# Altium project GPS_Tracker.PrjPcb (part 1 of 2)
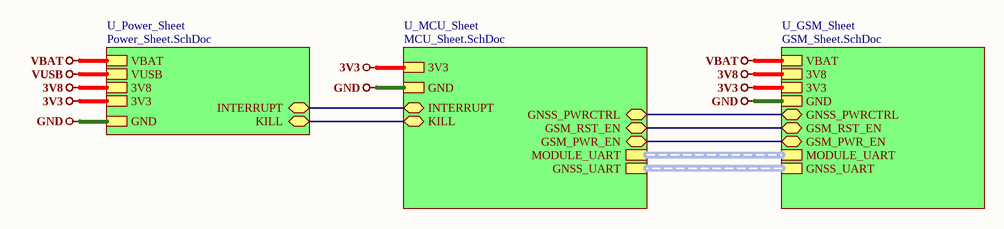
[diagram p0: Top_Sheet.SchDoc]
4 sheets, 134 parts. Net scope: hierarchical (ports join the sheet entries above them; power ports are global).
Sheets:
  Top_Sheet.SchDoc
    U_GSM_Sheet = GSM_Sheet.SchDoc
    U_Power_Sheet = Power_Sheet.SchDoc
    U_MCU_Sheet = MCU_Sheet.SchDoc

## Sheet Top_Sheet.SchDoc
size A4; SheetNumber: 1; SheetTotal: 4

### Sub-sheets
U_GSM_Sheet = GSM_Sheet.SchDoc: GSM_PWR_EN (bidir), GSM_RST_EN (bidir), MODULE_UART (harness MODULE_UART), GND, 3V8, VBAT, 3V3, GNSS_UART (harness GNSS_UART), GNSS_PWRCTRL (bidir)
U_MCU_Sheet = MCU_Sheet.SchDoc: MODULE_UART (harness MODULE_UART), GNSS_UART (harness GNSS_UART), GSM_PWR_EN (bidir), GSM_RST_EN (bidir), GNSS_PWRCTRL (bidir), GND, 3V3, INTERRUPT (bidir), KILL (bidir)
U_Power_Sheet = Power_Sheet.SchDoc: GND, 3V8, VUSB, VBAT, 3V3, INTERRUPT (bidir), KILL (bidir)

### Nets
3V3: sheet U_GSM_Sheet/3V3, sheet U_Power_Sheet/3V3, sheet U_MCU_Sheet/3V3
3V8: sheet U_GSM_Sheet/3V8, sheet U_Power_Sheet/3V8
GND: sheet U_GSM_Sheet/GND, sheet U_Power_Sheet/GND, sheet U_MCU_Sheet/GND
VBAT: sheet U_GSM_Sheet/VBAT, sheet U_Power_Sheet/VBAT
VUSB: sheet U_Power_Sheet/VUSB
GNSS_PWRCTRL: sheet U_GSM_Sheet/GNSS_PWRCTRL, sheet U_MCU_Sheet/GNSS_PWRCTRL
GSM_PWR_EN: sheet U_GSM_Sheet/GSM_PWR_EN, sheet U_MCU_Sheet/GSM_PWR_EN
GSM_RST_EN: sheet U_GSM_Sheet/GSM_RST_EN, sheet U_MCU_Sheet/GSM_RST_EN
INTERRUPT: sheet U_Power_Sheet/INTERRUPT, sheet U_MCU_Sheet/INTERRUPT
KILL: sheet U_Power_Sheet/KILL, sheet U_MCU_Sheet/KILL

### Buses and harness runs
harness sheet U_GSM_Sheet/GNSS_UART = sheet U_MCU_Sheet/GNSS_UART
harness sheet U_GSM_Sheet/MODULE_UART = sheet U_MCU_Sheet/MODULE_UART

### Notes on the sheet
- File:
- Title:
- Date:
- Page
- Num:
- Total:
- Drawn By: Huzaifa Ali

## Sheet GSM_Sheet.SchDoc
size 420 x 297 mm; SheetNumber: 4; SheetTotal: 4
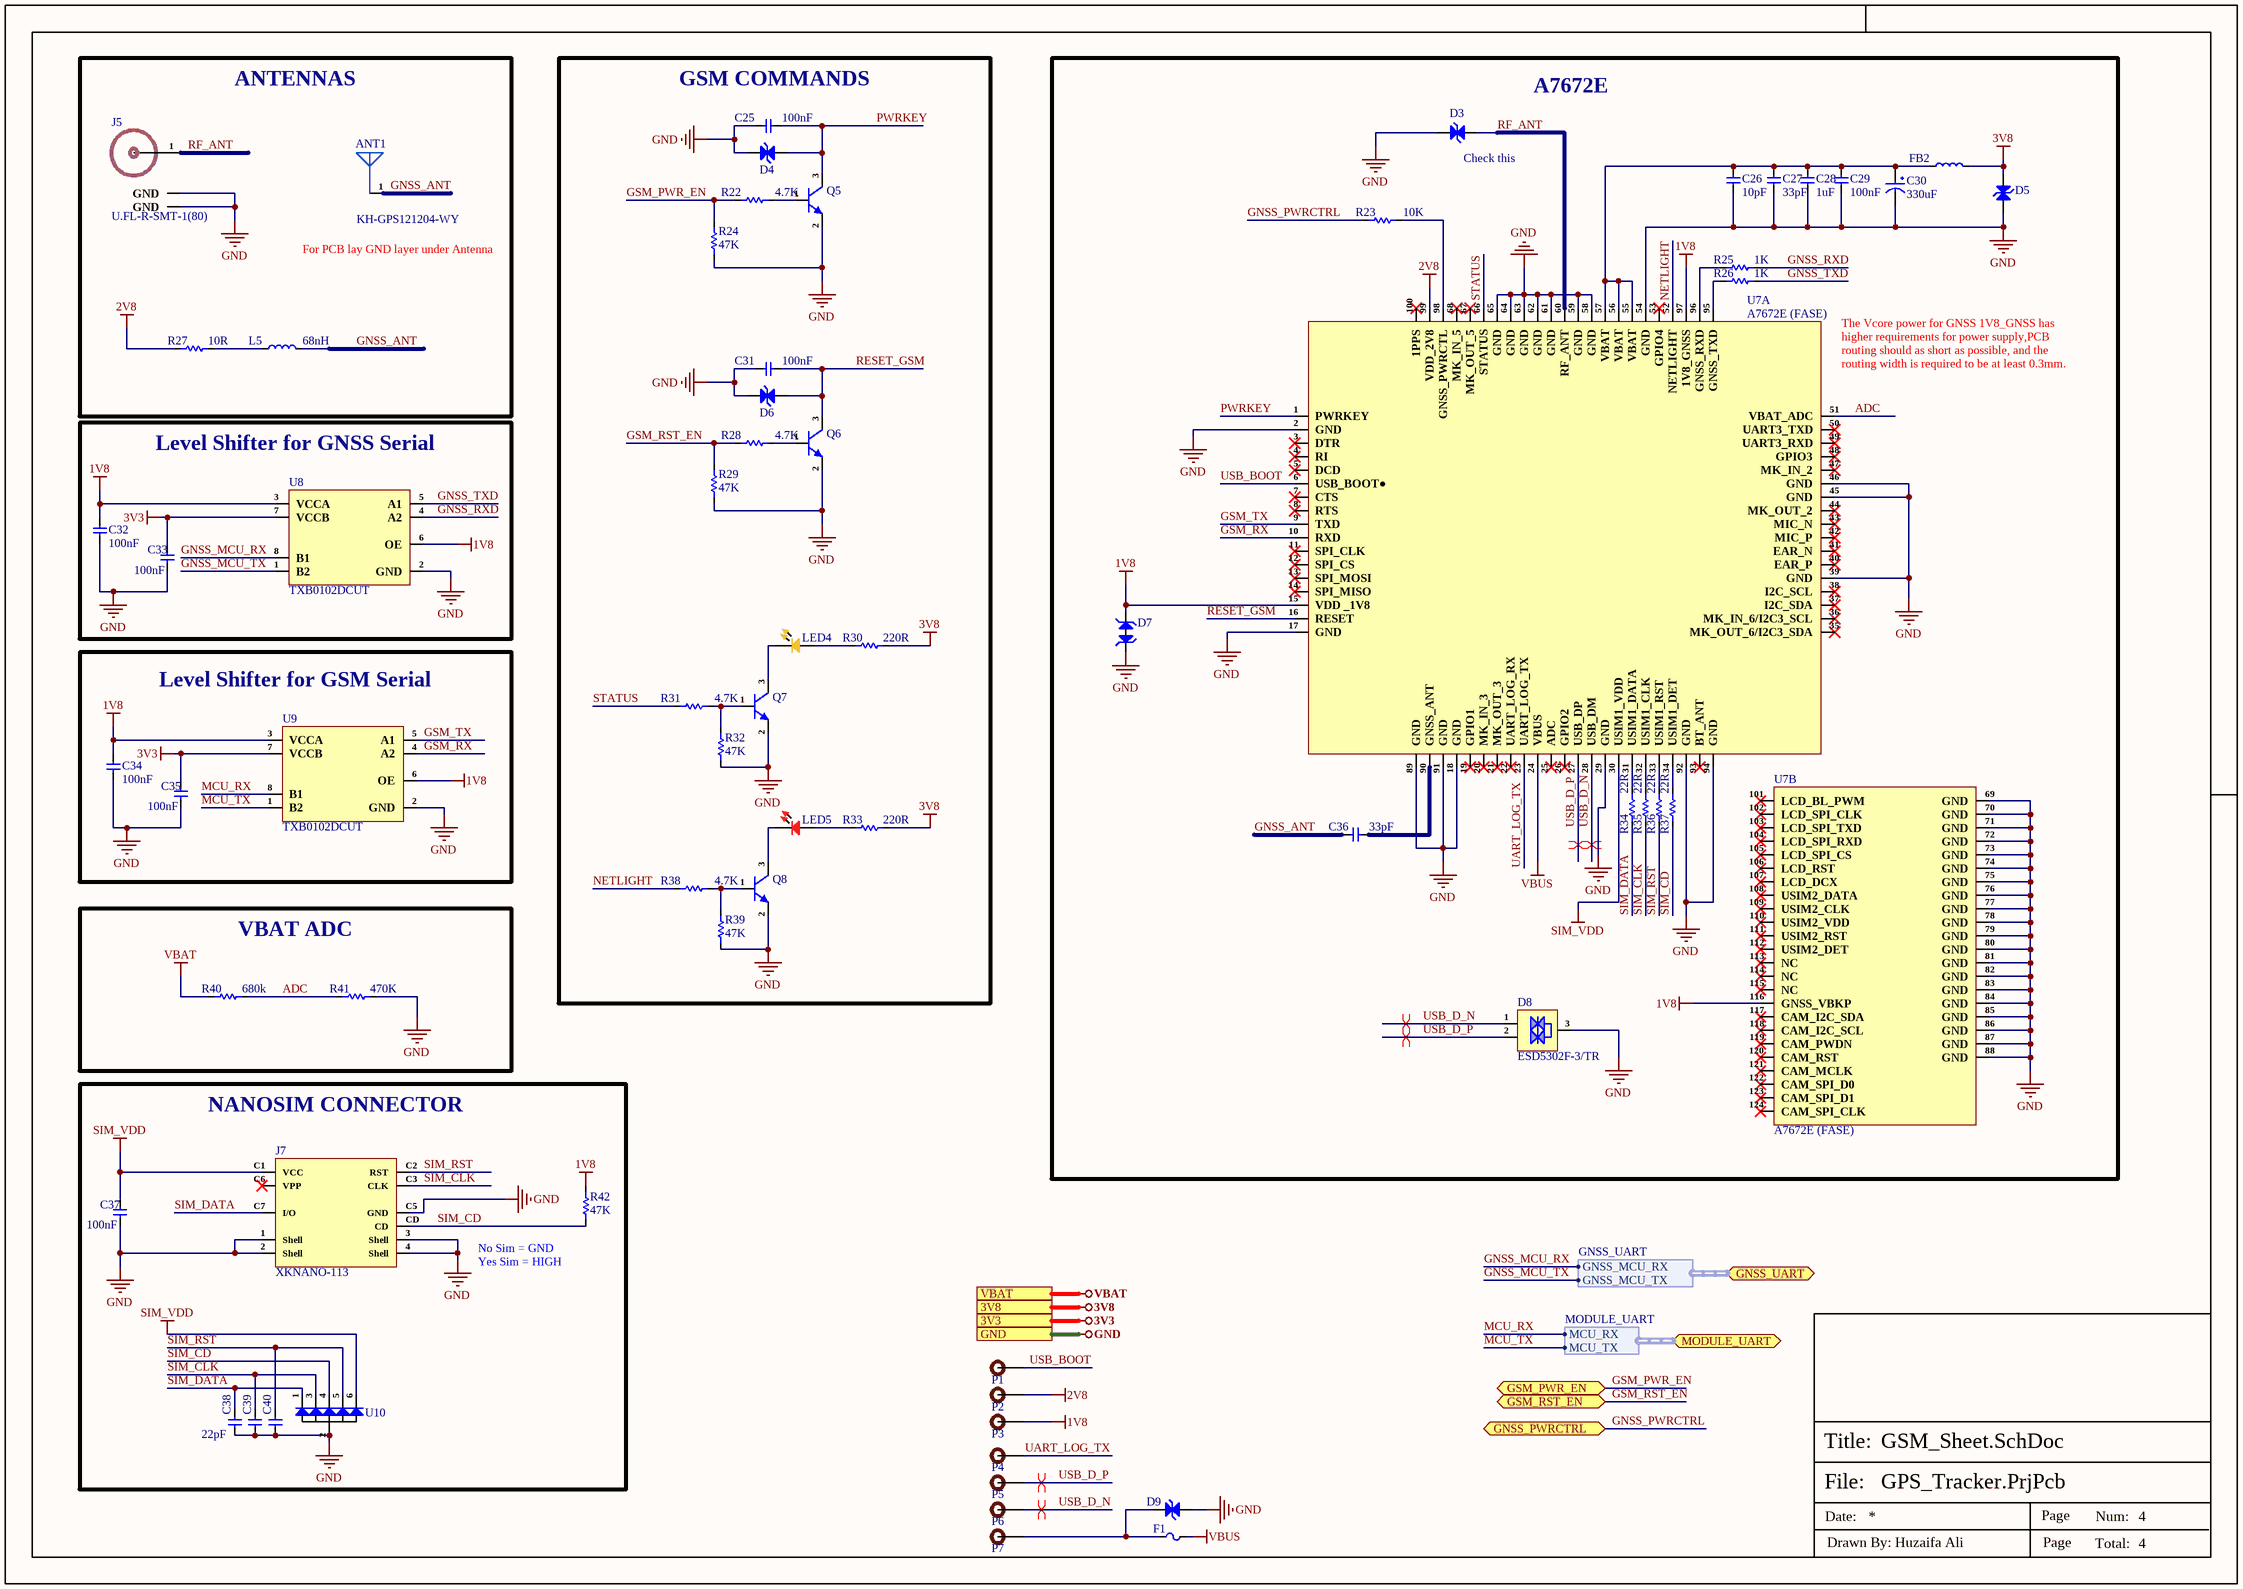
[diagram p1: GSM_Sheet.SchDoc]

### Parts
ANT1  KH-GPS121204-WY  [KH-GPS121204-WY]
C25  100nF  [CAP-0201]
C26  10pF  [CAP-0201]
C27  33pF  [CAP-0201]
C28  1uF  [CAP-0201]
C29  100nF  [CAP-0201]
C30  330uF  [Case-E]
C31  100nF  [CAP-0201]
C32  100nF  [CAP-0201]
C33  100nF  [CAP-0201]
C34  100nF  [CAP-0201]
C35  100nF  [CAP-0201]
C36  33pF  [CAP-0201]
C37  100nF  [CAP-0201]
C38  22pF  [CAP-0201]
C39  22pF  [CAP-0201]  (value not drawn)
C40  22pF  [CAP-0201]  (value not drawn)
D3  LXES15AAA1-153  [Diode 0402]  (value not drawn)
D4  LESD5D5.0CT1G  [SOD-523]  (value not drawn)
D5  LESD5D5.0CT1G  [SOD-523]  (value not drawn)
D6  LESD5D5.0CT1G  [SOD-523]  (value not drawn)
D7  ESD5651N-2/TR  [DFN1006-2L_]  (value not drawn)
D8  ESD5302F-3/TR  [Sot-23]
D9  LESD5D5.0CT1G  [SOD-523]  (value not drawn)
F1  SMD0603-050  [Fuse-0603]  (value not drawn)
FB2  100MHz  [Ind-0805]  (value not drawn)
J5  U.FL-R-SMT-1(80)  [U.FL-R-SMT-1(80)_]
J7  XKNANO-113  [XKNANO-113]
L5  68nH  [IND-0603 (1608 Metric)]
LED4  Yellow  [LED-0603]  (value not drawn)
LED5  RED  [LED-0603]  (value not drawn)
P1  TEST POINT  [Test-point]  (value not drawn)
P2  TEST POINT  [Test-point]  (value not drawn)
P3  TEST POINT  [Test-point]  (value not drawn)
P4  TEST POINT  [Test-point]  (value not drawn)
P5  TEST POINT  [Test-point]  (value not drawn)
P6  TEST POINT  [Test-point]  (value not drawn)
P7  TEST POINT  [Test-point]  (value not drawn)
Q5  MMBT3904M  [SOT-723]  (value not drawn)
Q6  MMBT3904M  [SOT-723]  (value not drawn)
Q7  MMBT3904M  [SOT-723]  (value not drawn)
Q8  MMBT3904M  [SOT-723]  (value not drawn)
R22  4.7K  [Res-0201]
R23  10K  [Res-0201]
R24  47K  [Res-0201]
R25  1K  [Res-0201]
R26  1K  [Res-0201]
R27  10R  [Res-0402]
R28  4.7K  [Res-0201]
R29  47K  [Res-0201]
R30  220R  [Res-0201]
R31  4.7K  [Res-0201]
R32  47K  [Res-0201]
R33  220R  [Res-0201]
R34  22R  [Res-0201]
R35  22R  [Res-0201]
R36  22R  [Res-0201]
R37  22R  [Res-0201]
R38  4.7K  [Res-0201]
R39  47K  [Res-0201]
R40  680k  [Res-0402]
R41  470K  [Res-0402]
R42  47K  [Res-0201]
U7  A7672E (FASE)  [A7672E (FASE)]  (parts A,B of 2)
U8  TXB0102DCUT  [TXB0102DCUT]
U9  TXB0102DCUT  [TXB0102DCUT]
U10  SMF05CT1G-ES  [SOT-363]  (value not drawn)

### Blocks framed on the sheet
ANTENNAS: ANT1 J5 L5 R27
GSM COMMANDS: C25 C31 D4 D6 LED4 LED5 Q5-Q8 R22 R24 R28-R33 R38 R39
A7672E: C26-C30 C36 D3 D5 D7 D8 FB2 R23 R25 R26 R34-R37 U7
Level Shifter for GNSS Serial: C32 C33 U8
Level Shifter for GSM Serial: C34 C35 U9
VBAT ADC: R40 R41
NANOSIM CONNECTOR: C37-C40 J7 R42 U10

### Ports
3V3, 3V8, GND, GNSS_PWRCTRL (bidir), GNSS_UART (bidir, harness GNSS_UART), GSM_PWR_EN (bidir), GSM_RST_EN (bidir), MODULE_UART (bidir, harness MODULE_UART), VBAT

### Harnesses
MODULE_UART: MCU_RX, MCU_TX
GNSS_UART: GNSS_MCU_RX, GNSS_MCU_TX

### Nets
1V8: C32.1 C34.1 D7.2(K) P3.1 R42.2 U7.15(VDD__1V8) U7.97(1V8_GNSS) U7.116(GNSS_VBKP) U8.3(VCCA) U8.6(OE) U9.3(VCCA) U9.6(OE)
2V8: P2.1 R27.1 U7.99(VDD_2V8)
3V3: C33.1 C35.1 U8.7(VCCB) U9.7(VCCB) ; port 3V3
3V8: D5.2(A) FB2.2 R30.2 R33.2 ; port 3V8
GND: C25.2 C26.1 C27.1 C28.1 C29.1 C30.2 C31.2 C32.2 C33.2 C34.2 C35.2 C37.2 C38.1 C39.1 C40.1 D3.1(A) D4.2(A) D5.1(A) D6.2(A) D7.1(K) D8.3(GND) D9.1(A) J5.2(GND) J5.3(GND) J7.1(Shell) J7.2(Shell) J7.3(Shell) J7.4(Shell) J7.C5(GND) Q5.2(E) Q6.2(E) Q7.2(E) Q8.2(E) R24.1 R29.1 R32.1 R39.1 R41.2 U7.2(GND) U7.17(GND) U7.18(GND) U7.29(GND) U7.39(GND) U7.45(GND) U7.46(GND) U7.54(GND) U7.58(GND) U7.59(GND) U7.61(GND) U7.62(GND) U7.63(GND) U7.64(GND) U7.65(GND) U7.69(GND) U7.70(GND) U7.71(GND) U7.72(GND) U7.73(GND) U7.74(GND) U7.75(GND) U7.76(GND) U7.77(GND) U7.78(GND) U7.79(GND) U7.80(GND) U7.81(GND) U7.82(GND) U7.83(GND) U7.84(GND) U7.85(GND) U7.86(GND) U7.87(GND) U7.88(GND) U7.89(GND) U7.91(GND) U7.92(GND) U7.94(GND) U8.2(GND) U9.2(GND) U10.2(A) ; port GND
SIM_VDD: C37.1 J7.C1(VCC) U7.30(USIM1_VDD) U10.6(IO5)
VBAT: R40.2 ; port VBAT
VBUS: F1.2 U7.24(VBUS)
ADC: R40.1 R41.1 U7.51(VBAT_ADC)
GNSS_ANT: ANT1.1 C36.2 L5.2
GNSS_MCU_RX: U8.8(B1) ; port GNSS_UART.GNSS_MCU_RX
GNSS_MCU_TX: U8.1(B2) ; port GNSS_UART.GNSS_MCU_TX
GNSS_PWRCTRL: R23.2 ; port GNSS_PWRCTRL
GNSS_RXD: R25.2 U8.4(A2)
GNSS_TXD: R26.2 U8.5(A1)
GSM_PWR_EN: R22.1 R24.2 ; port GSM_PWR_EN
GSM_RST_EN: R28.1 R29.2 ; port GSM_RST_EN
GSM_RX: U7.10(RXD) U9.4(A2)
GSM_TX: U7.9(TXD) U9.5(A1)
MCU_RX: U9.8(B1) ; port MODULE_UART.MCU_RX
MCU_TX: U9.1(B2) ; port MODULE_UART.MCU_TX
NETLIGHT: R38.1 U7.52(NETLIGHT)
PWRKEY: C25.1 D4.1(A) Q5.3(C) U7.1(PWRKEY)
RESET_GSM: C31.1 D6.1(A) Q6.3(C) U7.16(RESET)
RF_ANT: D3.2(A) J5.1(RF_IN) U7.60(RF_ANT)
SIM_CD: J7.CD R37.1 R42.1 U10.4(IO3)
SIM_CLK: C39.2 J7.C3(CLK) R35.1 U10.3(IO2)
SIM_DATA: C38.2 J7.C7(I/O) R34.1 U10.1(IO1)
SIM_RST: C40.2 J7.C2(RST) R36.1 U10.5(IO4)
STATUS: R31.1 U7.66(STATUS)
UART_LOG_TX: P4.1 U7.23(UART_LOG_TX)
USB_BOOT: P1.1 U7.6(USB_BOOT●)
USB_D_N: D8.1(I/O1) P6.1 U7.28(USB_DM)
USB_D_P: D8.2(I/O2) P5.1 U7.27(USB_DP)
NetC26_2: C26.2 C27.2 C28.2 C29.2 C30.1 FB2.1 U7.55(VBAT) U7.56(VBAT) U7.57(VBAT)
NetC36_1: C36.1 U7.90(GNSS_ANT)
NetD9_2: D9.2(A) F1.1 P7.1
NetL5_1: L5.1 R27.2
NetLED4_1: LED4.1 R30.1
NetLED4_2: LED4.2 Q7.3(C)
NetLED5_1: LED5.1 R33.1
NetLED5_2: LED5.2 Q8.3(C)
NetQ5_1: Q5.1(B) R22.2
NetQ6_1: Q6.1(B) R28.2
NetQ7_1: Q7.1(B) R31.2 R32.2
NetQ8_1: Q8.1(B) R38.2 R39.2
NetR23_1: R23.1 U7.98(GNSS_PWRCTL)
NetR25_1: R25.1 U7.96(GNSS_RXD)
NetR26_1: R26.1 U7.95(GNSS_TXD)
NetR34_2: R34.2 U7.31(USIM1_DATA)
NetR35_2: R35.2 U7.32(USIM1_CLK)
NetR36_2: R36.2 U7.33(USIM1_RST)
NetR37_2: R37.2 U7.34(USIM1_DET)

Not connected (* = marked no-connect by the designer): J7 C6(VPP)*; U7 3(DTR)* 4(RI)* 5(DCD)* 7(CTS)* 8(RTS)* 11(SPI_CLK)* 12(SPI_CS)* 13(SPI_MOSI)* 14(SPI_MISO)* 19(GPIO1)* 20(MK_IN_3)* 21(MK_OUT_3)* 22(UART_LOG_RX)* 25(ADC)* 26(GPIO2)* 35(MK_OUT_6/I2C3_SDA)* 36(MK_IN_6/I2C3_SCL)* 37(I2C_SDA)* 38(I2C_SCL)* 40(EAR_P)* 41(EAR_N)* 42(MIC_P)* 43(MIC_N)* 44(MK_OUT_2)* 47(MK_IN_2)* 48(GPIO3)* 49(UART3_RXD)* 50(UART3_TXD)* 53(GPIO4)* 67(MK_OUT_5)* 68(MK_IN_5)* 93(BT_ANT)* 100(1PPS)* 101(LCD_BL_PWM)* 102(LCD_SPI_CLK)* 103(LCD_SPI_TXD)* 104(LCD_SPI_RXD)* 105(LCD_SPI_CS)* 106(LCD_RST)* 107(LCD_DCX)* 108(USIM2_DATA)* 109(USIM2_CLK)* 110(USIM2_VDD)* 111(USIM2_RST)* 112(USIM2_DET)* 113(NC)* 114(NC)* 115(NC)* 117(CAM_I2C_SDA)* 118(CAM_I2C_SCL)* 119(CAM_PWDN)* 120(CAM_RST)* 121(CAM_MCLK)* 122(CAM_SPI_D0)* 123(CAM_SPI_D1)* 124(CAM_SPI_CLK)*

### Layout directives
differential pair; net class GSM_USB; differential pair class GSM_USB_Lines; rule Impedance Constraint [Min = 88.00    Max = 90.00    ]; rule Matched Net Lengths [Tolerance = 20mil]: USB_D_N, USB_D_P

### Notes on the sheet
- (near D3) Check this
- (near ANT1) For PCB lay GND layer under Antenna
- (near U7) The Vcore power for GNSS 1V8_GNSS has higher requirements for power supply,PCB routing should as short as possible, and the routing width is required to be at least 0.3mm.
- (near R42) No Sim = GND
  Yes Sim = HIGH
- File:
- Title:
- Date:
- Page
- Num:
- Total:
- Drawn By: Huzaifa Ali

### Library data of the parts
ANT1 = KH-GPS121204-WY: Antennas ROHS; Manufacturer: Shenzhen Kinghelm Elec; Manufacturer Part Number: KH-GPS121204-WY; Package: Custom; LCSC Part Number: C962213; Item Type: Antenna; ComponentLink1Description: LCSC; ComponentLink1URL: https://www.lcsc.com/product-detail/Antennas_Shenzhen-Kinghelm-Elec-KH-GPS121204-WY_C962213.html
C25 C29 C31-C35 C37 = CC0201KRX5R6BB104: CAP CER 0.1UF 10V X5R 0201; Manufacturer: Yageo; Tolerance: 10%; Supplier 1: Mouser; Manufacturer Part Number: CC0201KRX5R6BB104; RoHS: Yes; Category: Ceramic Capacitors; Stock 1: 824403; Pricing 1: 1=0.10000, 10=0.02400, 50=0.02400, 100=0.01900, 1000=0.01100, 10000=0.00900 (USD); Mount: Surface Mount; Case/Package: 0201; Case Code (Imperial): 0201; Case Code (Metric): 0603; Weight: 6E-06oz; Min Operating Temperature: -55°C; Max Operating Temperature: 85°C; Capacitance: 100nF; Dielectric: X5R; Voltage Rating (DC): 10V; Packaging: Tape and Reel; Termination: SMD/SMT; Resistor Type: Ceramic; Voltage Rating: 10V; Series: CC; Construction: Flat; Length: 0.6mm; Width: 0.012inch; Height: 0.3mm; Thickness: 0.013inch; Depth: 0.3mm; Radiation Hardening: No; Lead Free: Lead Free; Halogen Free: Halogen Free; RoHS Compliant: Yes; ComponentLink1URL: https://datasheet.ciiva.com/11587/upy-gphc-x5r-4v-to-50v-12-11587190.pdf?src-supplier=Avnet; ComponentLink1Description: https://datasheet.ciiva.com/11587/upy-gphc-x5r-4v-to-50v-12-11587190.pdf?src-supplier=Avnet; Supplier Part Number 1: 603-CC201KRX5R6BB104; LCSC Part Number: C190183
C26 = CGA1A2C0G1E100D030BA: CAP CER 10PF 25V C0G 0201; Manufacturer: TDK; Item Type: Capacitor; Supplier 1: Digi-Key; Manufacturer Part Number: CGA1A2C0G1E100D030BA; RoHS: Yes; Category: Ceramic Capacitors; Stock 1: 28695; Pricing 1: 1=0.11000, 10=0.07900, 50=0.04340, 100=0.03540, 500=0.02530, 1000=0.01987, 2500=0.01807, 5000=0.01662 (USD); Mount: Surface Mount; Case/Package: 0201; Case Code (Imperial): 0201; Case Code (Metric): 0603; Weight: 6E-06oz; Min Operating Temperature: -55°C; Max Operating Temperature: 125°C; Packaging: Tape and Reel; Capacitance: 10pF; Voltage Rating: 25V; Termination: SMD/SMT; Voltage Rating (DC): 25V; Package Quantity: 1; Dielectric: C0G; Resistor Type: Ceramic; Series: CGA; Length: 0.6mm; Width: 0.3mm; Height: 0.3mm; Thickness: 0.013inch; Depth: 0.3mm; Ratings: AEC-Q200; RoHS Compliant: Yes; ComponentLink1URL: https://datasheet.ciiva.com/24220/cga1a2c0g1e100d030ba-271838-24220873.pdf?src-supplier=Mouser; ComponentLink1Description: https://datasheet.ciiva.com/24220/cga1a2c0g1e100d030ba-271838-24220873.pdf?src-supplier=Mouser; Supplier Part Number 1: 445-9023-1-ND; LCSC Part Number: C2168728
C27 C36 = CC0201JRNPO9BN330: CAP CER 33PF 50V C0G/NPO 0201; Manufacturer: Yageo; Item Type: Capacitor; Supplier: Future Electronics; Supplier Part Number: 7106789; Manufacturer Part Number: CC0201JRNPO9BN330; RoHS: Yes; Category: Ceramic Capacitors; Stock: 2085000; Pricing: 15000=0.0012, 60000=0.0011, 225000=0.0011, 600000=0.001, 1500000=0.001 (USD); ComponentLink1URL: https://datasheet.ciiva.com/13211/upy-gp-np0-16v-to-50v-8-13211019.pdf?src-supplier=Mouser; ComponentLink1Description: https://datasheet.ciiva.com/13211/upy-gp-np0-16v-to-50v-8-13211019.pdf?src-supplier=Mouser; LCSC Part Number: C277477
C28 = CC0201MRX5R7BB105: CAP CER 1UF 16V X5R 0201; Manufacturer: Yageo; Item Type: Capacitor; Supplier: Digi-Key; Supplier Part Number: 13-CC0201MRX5R7BB105TR-ND; Manufacturer Part Number: CC0201MRX5R7BB105; RoHS: Yes; Category: Ceramic Capacitors; LCSC Part Number: C5182464
C30 = TAJE337M016RNJ: CAP TANT 330UF 20% 16V 2917; Manufacturer: Kyocera AVX; ESR (Equivalent Series Resistance): 400mR; Leakage Current: 52.8uA; Dissipation Factor: 30%; Item Type: Capacitor; Supplier 1: Arrow Electronics; Manufacturer Part Number: TAJE337M016RNJ; RoHS: Yes; Category: Tantalum Capacitors; Stock 1: 4000; Pricing 1: 400=1.8678, 2000=1.7998, 4000=1.7657, 6000=1.7481, 10000=1.7306, 30000=1.7133, 50000=1.6961 (USD); Mounting Technology: Surface Mount; Case/Package: 2917; Case Code (Imperial): 2917; Case Code (Metric): 7343; Min Operating Temperature: -55°C; Max Operating Temperature: 125°C; Voltage Rating: 16V; Tolerance: 20%; Packaging: Tape and Reel; Value: 330uF; Termination: SMD/SMT; Voltage Rating (DC): 16V; Series: TAJ; Features: General Purpose; Length: 7.3mm; Width: 4.3mm; Height: 4.3mm; Lead Free: Lead Free; RoHS Compliant: Yes; ComponentLink1URL: https://datasheet.ciiva.com/12882/taj-27497-12882412.pdf?src-supplier=Mouser; ComponentLink1Description: https://datasheet.ciiva.com/12882/taj-27497-12882412.pdf?src-supplier=Mouser; Supplier Part Number 1: TAJE337M016RNJ; LCSC Part Number: C51599
C38-C40 = GRM0335C1H220JA01D: CAP CER 22PF 50V C0G/NP0 0201; Manufacturer: Murata; Material: 4241ConductorMaterial; Tolerance: 5%; Dielectric: C0G; Temperature Coefficient: 30ppm/°C; Item Type: Capacitor; Supplier: Rs; Supplier Part Number: 8202728; Manufacturer Part Number: GRM0335C1H220JA01D; RoHS: Yes; Category: Ceramic Capacitors; Stock: 9500; Pricing: 500=0.004, 5000=0.003, 12500=0.002, 50000=0.002 (GBP); Mounting Technology: Surface Mount; Case/Package: 0201; Case Code (Metric): 0603; Case Code (Imperial): 0201; Min Operating Temperature: -55°C; Max Operating Temperature: 125°C; Package Quantity: 1; Value: 22pF; Voltage Rating: 50V; Packaging: Tape and Reel; Termination: SMD/SMT; Voltage: 50V; Voltage Rating (DC): 50V; Series: GRM; Length: 0.024inch; Width: 0.012inch; Height: 0.3mm; Depth: 0.3mm; Lead Free: Lead Free; RoHS Compliant: Yes; ComponentLink1URL: https://datasheet.ciiva.com/6271/partnumbering-e-01-6271146.pdf?src-supplier=Digi-Key; ComponentLink1Description: https://datasheet.ciiva.com/6271/partnumbering-e-01-6271146.pdf?src-supplier=Digi-Key; ComponentLink2URL: https://datasheet.ciiva.com/6271/partnumbering-e-01-6271143.pdf?src-supplier=Digi-Key; ComponentLink2Description: https://datasheet.ciiva.com/6271/partnumbering-e-01-6271143.pdf?src-supplier=Digi-Key; ComponentLink3URL: https://datasheet.ciiva.com/6271/partnumbering-e-01-6271149.pdf?src-supplier=Digi-Key; ComponentLink3Description: https://datasheet.ciiva.com/6271/partnumbering-e-01-6271149.pdf?src-supplier=Digi-Key; LCSC Part Number: C76924
D3 = LXES15AAA1-153: 0402 TVS ROHS; Manufacturer: Leiditech; Item Type: TVS Diode; Manufacturer Part Number: LXES15AAA1-153; Package: 0402; LCSC Part Number: C5210978; ComponentLink1Description: LCSC; ComponentLink1URL: https://www.lcsc.com/product-detail/TVS_Leiditech-LXES15AAA1-153_C5210978.html
D4-D6 D9 = LESD5D5.0CT1G: SOD-523 ESD Protection Devices ROHS; Manufacturer: UMW; Manufacturer Part Number: LESD5D5.0CT1G; Package: SOD-523; LCSC Part Number: C5199850; Item Type: Protection Device; ComponentLink1Description: LCSC; ComponentLink1URL: https://www.lcsc.com/product-detail/span-style-background-color-ff0-ESD-span-Protection-Devices_UMW-Youtai-Semiconductor-Co-Ltd-LESD5D5-0CT1G_C5199850.html
D7 = ESD5651N-2/TR: 35A@8/20us 15V 4.5V@Max Unidirectional DFN1006 TVS ROHS; Manufacturer: WILLSEMI(Will Semicon); Item Type: Diode; Manufacturer Part Number: ESD5651N-2/TR; Package: DFN1006; LCSC Part Number: C239784; ComponentLink1Description: LCSC; ComponentLink1URL: https://www.lcsc.com/product-detail/TVS_WILLSEMI-Will-Semicon-ESD5651N-2-TR_C239784.html
D8 = ESD5302F-3/TR: 16A 20V 7V 5V@Max Unidirectional SOT-23 TVS ROHS; Manufacturer: WILLSEMI; Item Type: Diode; Manufacturer Part Number: ESD5302F-3/TR; Package: SOT-23; LCSC Part Number: C239643; ComponentLink1Description: LCSC; ComponentLink1URL: https://www.lcsc.com/product-detail/TVS_WILLSEMI-Will-Semicon-ESD5302F-3-TR_C239643.html
F1 = SMD0603-050: 6V 500mA 40A 1A 0603 Resettable Fuses ROHS; Manufacturer: TECHFUSE; Item Type: Fuse; Supplier 1: LCSC; Manufacturer Part Number: SMD0603-050; RoHS: No; Category: Uncategorized; Supplier Part Number 1: C69679; LCSC Part Number: C69679; ComponentLink1Description: LCSC; ComponentLink1URL: https://www.lcsc.com/product-detail/Resettable-Fuses_TECHFUSE-SMD0603-050_C69679.html
FB2 = MPZ2012S221ATD25: FERRITE BEAD 220 OHM 0805 1LN; Manufacturer: TDK; Core Material: 228ConductorMaterial; Number of Lines: 1; Max Current Rating: 3A; Impedance: 220R; Tolerance: 25%; ESR: 40mR; Supplier: Avnet; Supplier Part Number: 45AC5565; Manufacturer Part Number: MPZ2012S221ATD25; RoHS: Yes; Category: Ferrite Beads and Chips; Stock: 4000; Pricing: 4000=0.03, 8000=0.029 (USD); Mounting Technology: Surface Mount; Case/Package: 0805; Case Code (Metric): 2012; Case Code (Imperial): 0805; Weight: 0.000194oz; Min Operating Temperature: -55°C; Max Operating Temperature: 125°C; Package Quantity: 4000; Packaging: Tape and Reel; Termination: SMD/SMT; Max DC Current: 3A; Test Frequency: 100MHz; Series: MPZ; RMS Current (Irms): 3A; Length: 2mm; Width: 1.25mm; Height: 0.85mm; Ratings: AEC-Q200; RoHS Compliant: Yes; Lead Free: 5697LeadFree; ComponentLink1URL: http://www.mouser.com/ds/2/400/eads_commercial_power_mpz2012_en-923646.pdf?src-supplier=Mouser; ComponentLink1Description: http://www.mouser.com/ds/2/400/eads_commercial_power_mpz2012_en-923646.pdf?src-supplier=Mouser; ComponentLink2URL: https://media.digikey.com/pdf/Data%20Sheets/TDK%20PDFs/MPZ_Series_Br.pdf?src-supplier=Digi-Key; ComponentLink2Description: https://media.digikey.com/pdf/Data%20Sheets/TDK%20PDFs/MPZ_Series_Br.pdf?src-supplier=Digi-Key; ComponentLink3URL: http://www.farnell.com/datasheets/2724091.pdf?src-supplier=Farnell; ComponentLink3Description: http://www.farnell.com/datasheets/2724091.pdf?src-supplier=Farnell; ComponentLink4URL: https://product.tdk.com/info/en/catalog/datasheets/beads_automotive_power_mpz2012_en.pdf?ref_disty=digikey&src-supplier=Digi-Key; ComponentLink4Description: https://product.tdk.com/info/en/catalog/datasheets/beads_automotive_power_mpz2012_en.pdf?ref_disty=digikey&src-supplier=Digi-Key; ComponentLink5URL: http://www.farnell.com/datasheets/2724091.pdf?src-supplier=Element14; ComponentLink5Description: http://www.farnell.com/datasheets/2724091.pdf?src-supplier=Element14; ComponentLink6URL: https://datasheet.octopart.com/MPZ2012S221ATD25-TDK-datasheet-99917311.pdf?src-supplier=Newark; ComponentLink6Description: https://datasheet.octopart.com/MPZ2012S221ATD25-TDK-datasheet-99917311.pdf?src-supplier=Newark; ComponentLink7URL: https://datasheet.octopart.com/MPZ2012S221ATD25-TDK-datasheet-166558464.pdf?src-supplier=TME; ComponentLink7Description: https://datasheet.octopart.com/MPZ2012S221ATD25-TDK-datasheet-166558464.pdf?src-supplier=TME; LCSC Part Number: C307778; Item Type: Ferrite Bead
J5 = U.FL-R-SMT-1(80): CONN U.FL RCPT STR 50 OHM SMD; Manufacturer: Hirose; Item Type: UFL Connector; Supplier 1: Future Electronics; Manufacturer Part Number: U.FL-R-SMT-1(80); Stock 1: 1272; Pricing 1: 1=1.07, 500=0.785, 1500=0.74, 2500=0.72, 5000=0.695 (USD); Case/Package: SMD/SMT; Package Quantity: 10000; Packaging: Tape and Reel; Lead Free: Lead Free; ComponentLink1URL: https://www.hirose.com/product/en/download_file/key_name/U.FL-R-SMT-1%2880%29/category/Specification%20Sheet/doc_file_id/37638/?file_category_id=9&item_id=03310472280&is_series=&src-supplier=Digi-Key; ComponentLink1Description: https://www.hirose.com/product/en/download_file/key_name/U.FL-R-SMT-1%2880%29/category/Specification%20Sheet/doc_file_id/37638/?file_category_id=9&item_id=03310472280&is_series=&src-supplier=Digi-Key; ComponentLink2URL: http://www.mouser.com/ds/2/185/U.FL_catalog-939761.pdf?src-supplier=Mouser; ComponentLink2Description: http://www.mouser.com/ds/2/185/U.FL_catalog-939761.pdf?src-supplier=Mouser; Supplier Part Number 1: U.FL-R-SMT-1(80)-CUTT; LCSC Part Number: C88374
J7 = XKNANO-113: Copper Alloy Self bomb Gold plating 1.25mm Deck -40℃~+85℃ 260℃ NanoSIM SMD SIM Card Connectors ROHS; Manufacturer: XKB Connectivity; Manufacturer Part Number: XKNANO-113; Package: SMD Custom; LCSC Part Number: C381071; Item Type: SIM Card Connectors; ComponentLink1Description: LCSC; ComponentLink1URL: https://www.lcsc.com/product-detail/SIM-Card-Connectors_XKB-Connectivity-XKNANO-113_C381071.html
L5 = 0603CS-68NXJLW: Ind Chip Wirewound 68nH 5% 200MHz 37Q-Factor Ceramic 600mA 0603; Manufacturer: Coilcraft; DC Resistance (DCR): 340mR; Q Factor: 21; Self Resonant Frequency: 1.7GHz; Item Type: Inductor; Supplier 1: Mouser; Manufacturer Part Number: 0603CS-68NXJLW; RoHS: Yes; Category: Fixed Inductors; Stock 1: 3257; Pricing 1: 1=0.96000, 10=0.95200, 50=0.95200, 100=0.95200, 1000=0.36200, 10000=0.30900 (USD); Case/Package: 0603; Weight: 7.1E-05oz; Core Material: Ceramic; Min Operating Temperature: -40°C; Max Operating Temperature: 125°C; Packaging: Tape and Reel; Tolerance: 5%; Inductance: 68nH; Max DC Current: 600mA; Termination: SMD/SMT; Test Frequency: 200MHz; Series: 0603CS; Length: 1.8mm; Width: 1.12mm; Height: 1.02mm; Lead Free: Contains Lead; RoHS Compliant: Yes; ComponentLink1URL: http://www.mouser.com/ds/2/597/0603cs-270694.pdf?src-supplier=Mouser; ComponentLink1Description: http://www.mouser.com/ds/2/597/0603cs-270694.pdf?src-supplier=Mouser; Supplier Part Number 1: 994-0603CS-68NXJLW
LED4 = 19-21/G6C-FM1N2B/3T: Yellow-Green 572nm LED Indication - Discrete 2.05V 0603 (1608 Metric); Manufacturer: Everlight Elec; Manufacturer Part Number: 19-21/G6C-FM1N2B/3T; Package: 0603; LCSC Part Number: C93689; Item Type: LED; ComponentLink1Description: LCSC; ComponentLink1URL: https://www.lcsc.com/product-detail/Light-Emitting-Diodes-LED_Everlight-Elec-19-21-G6C-FM1N2B-3T_C93689.html
LED5 = 19-21/R7C-AK1L2BY/3T: Red 632nm LED Indication - Discrete 2.05V 0603 (1608 Metric); Manufacturer: Everlight Elec; Manufacturer Part Number: 19-21/R7C-AK1L2BY/3T; Package: 0603; LCSC Part Number: C1322287; Item Type: LED; ComponentLink1Description: LCSC; ComponentLink1URL: https://www.lcsc.com/product-detail/Light-Emitting-Diodes-LED_Everlight-Elec-19-21-R7C-AK1L2BY-3T_C1322287.html
P1-P7 = TEST POINT: Test Point ON; Item Type: TEST POINT
Q5-Q8 = MMBT3904M: 40V 100mW 100@10mA,1V 200mA 300MHz 300mV@50mA,5mA NPN -55℃~+150℃@(Tj) SOT-723 Bipolar Transistors - BJT ROHS; Manufacturer: TECH PUBLIC; Item Type: Mosfet; ComponentLink1Description: LCSC; ComponentLink1URL: https://www.lcsc.com/product-detail/Bipolar-Transistors-BJT_TECH-PUBLIC-MMBT3904M_C2923360.html; Manufacturer Part Number: MMBT3904M; Package: SOT-723; LCSC Part Number: C2923360
R22 R28 R31 R38 = RC0201FR-074K7L: RES 4.7K OHM 1% 1/20W 0201; Manufacturer: Yageo; Item Type: Resistor; Supplier: Future Electronics; Supplier Part Number: 7537285; Manufacturer Part Number: RC0201FR-074K7L; RoHS: Yes; Category: Chip SMD Resistors; Stock: 1610000; Pricing: 10000=0.0014, 50000=0.0013, 250000=0.0013, 750000=0.0012, 2000000=0.0011 (USD); ComponentLink1URL: https://datasheet.ciiva.com/2493/pyu-r-int-thick-7-2493811.pdf?src-supplier=Digi-Key; ComponentLink1Description: https://datasheet.ciiva.com/2493/pyu-r-int-thick-7-2493811.pdf?src-supplier=Digi-Key; ComponentLink2URL: https://datasheet.ciiva.com/2493/pyu-r-int-thick-7-2493812.pdf?src-supplier=Digi-Key; ComponentLink2Description: https://datasheet.ciiva.com/2493/pyu-r-int-thick-7-2493812.pdf?src-supplier=Digi-Key; ComponentLink3URL: https://datasheet.ciiva.com/2493/pyu-r-int-thick-7-2493813.pdf?src-supplier=Digi-Key; ComponentLink3Description: https://datasheet.ciiva.com/2493/pyu-r-int-thick-7-2493813.pdf?src-supplier=Digi-Key; ComponentLink4URL: https://datasheet.ciiva.com/8892/pyu-rc0201-51-rohs-l-8-8892942.pdf?src-supplier=Avnet; ComponentLink4Description: https://datasheet.ciiva.com/8892/pyu-rc0201-51-rohs-l-8-8892942.pdf?src-supplier=Avnet; ComponentLink5URL: https://datasheet.ciiva.com/7672/1563626-7672233.pdf?src-supplier=Element14; ComponentLink5Description: https://datasheet.ciiva.com/7672/1563626-7672233.pdf?src-supplier=Element14; LCSC Part Number: C138135
R23 = RC0201FR-0710KL: RES SMD 10K OHM 1% 1/20W 0201; Manufacturer: Yageo; Item Type: Resistor; Manufacturer Part Number: RC0201FR-0710KL; Package: 0201; ComponentLink7Description: LCSC; ComponentLink7URL: https://www.lcsc.com/product-detail/Chip-Resistor-Surface-Mount_YAGEO-RC0201FR-0710KL_C106225.html; LCSC Part Number: C106225
R24 R29 R32 R39 R42 = RC0201FR-0747KL: RES 47K OHM 1% 1/20W 0201; Manufacturer: Yageo; Value: 47kR; Temperature Coefficient: 200ppm/°C; Power Rating: 50mW; Voltage Rating: 25V; Item Type: Resistor; Supplier: Future Electronics; Supplier Part Number: 7316417; Manufacturer Part Number: RC0201FR-0747KL; RoHS: Yes; Category: Chip SMD Resistors; Stock: 1020000; Pricing: 10000=0.0014, 50000=0.0013, 250000=0.0013, 750000=0.0012, 2000000=0.0011 (USD); Case/Package: 0201; Contact Plating: Tin,Matte; Case Code (Metric): 0603; Case Code (Imperial): 0201; Weight: 6E-06oz; Min Operating Temperature: -55°C; Max Operating Temperature: 125°C; Tolerance: 1%; Resistor Type: Thick Film; Packaging: Tape and Reel; Package Quantity: 10000; Number of Terminations: 2; Termination: SMD/SMT; Max Power Dissipation: 50mW; Features: Moisture Resistant; Series: RC; Resistance Tolerance: 1%; Construction: Rectangular; Length: 0.6mm; Width: 0.3mm; Height: 0.01inch; Depth: 0.3mm; Military Standard: Not; RoHS Compliant: Yes; Reach SVHC Compliant: Unknown; Lead Free: 5697LeadFree; ComponentLink1URL: https://datasheet.ciiva.com/7672/1563626-7672232.pdf?src-supplier=Element14; ComponentLink1Description: https://datasheet.ciiva.com/7672/1563626-7672232.pdf?src-supplier=Element14; ComponentLink2URL: https://datasheet.ciiva.com/29710/pyu-r-int-thick-7-29710919.pdf?src-supplier=Digi-Key; ComponentLink2Description: https://datasheet.ciiva.com/29710/pyu-r-int-thick-7-29710919.pdf?src-supplier=Digi-Key; ComponentLink3URL: https://datasheet.ciiva.com/29710/pyu-r-int-thick-7-29710920.pdf?src-supplier=Digi-Key; ComponentLink3Description: https://datasheet.ciiva.com/29710/pyu-r-int-thick-7-29710920.pdf?src-supplier=Digi-Key; ComponentLink4URL: https://datasheet.ciiva.com/25647/pyu-r-int-thick-7-25647310.pdf?src-supplier=Digi-Key; ComponentLink4Description: https://datasheet.ciiva.com/25647/pyu-r-int-thick-7-25647310.pdf?src-supplier=Digi-Key; ComponentLink5URL: https://datasheet.ciiva.com/26829/getdatasheetpartid-422496-26829867.pdf?src-supplier=Verical; ComponentLink5Description: https://datasheet.ciiva.com/26829/getdatasheetpartid-422496-26829867.pdf?src-supplier=Verical; ComponentLink6URL: https://datasheet.ciiva.com/8889/pyu-rc0201-51-rohs-l-8-8889065.pdf?src-supplier=Avnet; ComponentLink6Description: https://datasheet.ciiva.com/8889/pyu-rc0201-51-rohs-l-8-8889065.pdf?src-supplier=Avnet; LCSC Part Number: C138139
R25 R26 = RC0201FR-071KP: RES 1K OHM 1% 1/20W 0201; Manufacturer: Yageo; Supplier 1: Digi-Key; Manufacturer Part Number: RC0201FR-071KP; RoHS: Yes; Stock 1: 4800; Pricing 1: 1=0.11000, 10=0.10200, 100=0.03940, 1000=0.01734, 2500=0.01497, 5000=0.01340 (USD); RoHS Compliant: Yes; Supplier Part Number 1: 13-RC0201FR-071KPCT-ND; LCSC Part Number: C3953443
R27 = CRCW040210R0FKEDHP: RES SMD 10 OHM 1% 1/5W 0402; Manufacturer: Vishay Dale; Power Rating: 125mW; Voltage Rating: 50V; Temperature Coefficient: 100ppm/°C; Max Power Dissipation: 200mW; Supplier 1: Digi-Key; Manufacturer Part Number: CRCW040210R0FKEDHP; Stock 1: 28500; Pricing 1: 1=0.15, 10=0.132, 100=0.0506, 1000=0.02226, 2500=0.01923, 5000=0.0172 (USD); Mount: Surface Mount; Case/Package: 0402; Weight: 2.3E-05oz; Case Code (Imperial): 0402; Case Code (Metric): 1005; Contact Plating: Tin; Min Operating Temperature: -55°C; Max Operating Temperature: 155°C; Resistance: 10R; Tolerance: 1%; Packaging: Tape and Reel; Package Quantity: 10000; Termination: SMD/SMT; Resistor Type: Thick Film; Voltage Rating (DC): 50V; Features: Automotive AEC-Q200; Series: CRCW-HP; Number of Terminations: 2; Resistance Tolerance: 1%; Technology: THICK FILM; Construction: Rectangular; Length: 1mm; Width: 0.5mm; Height: 0.3mm; Depth: 0.5mm; Radiation Hardening: No; REACH SVHC: Unknown; Military Standard: Not; Lead Free: Lead Free; RoHS Compliant: Yes; ComponentLink1URL: http://www.mouser.com/ds/2/427/crcwhpe3-46056.pdf?src-supplier=Mouser; ComponentLink1Description: http://www.mouser.com/ds/2/427/crcwhpe3-46056.pdf?src-supplier=Mouser; Supplier Part Number 1: 541-10.0YCT-ND; LCSC Part Number: C4013850
R30 R33 = RC0201FR-07220RL: RES 220 OHM 1% 1/20W 0201; Manufacturer: Yageo; Temperature Coefficient: 200ppm/°C; Power Rating: 50mW; Voltage Rating: 25V; Supplier 1: Digi-Key; Manufacturer Part Number: RC0201FR-07220RL; RoHS: Yes; Category: Chip SMD Resistors; Stock 1: 189347; Pricing 1: 1=0.10000, 10=0.03600, 100=0.01480, 1000=0.00665, 2500=0.00577, 5000=0.00477 (USD); Case/Package: 0201; Contact Plating: Tin,Matte; Case Code (Imperial): 0201; Case Code (Metric): 0603; Min Operating Temperature: -55°C; Max Operating Temperature: 125°C; Resistance: 220R; Tolerance: 1%; Resistor Type: Thick Film; Packaging: Tape and Reel; Features: Moisture Resistant; Max Power Dissipation: 50mW; Number of Terminations: 2; Termination: SMD/SMT; Length: 0.6mm; Width: 0.012inch; Height: 0.01inch; Depth: 0.3mm; Radiation Hardening: No; REACH SVHC: Unknown; Military Standard: Not; ComponentLink1URL: https://datasheet.ciiva.com/7672/1563626-7672213.pdf?src-supplier=Element14; ComponentLink1Description: https://datasheet.ciiva.com/7672/1563626-7672213.pdf?src-supplier=Element14; ComponentLink2URL: https://datasheet.ciiva.com/8886/pyu-rc0201-51-rohs-l-8-8886758.pdf?src-supplier=Avnet; ComponentLink2Description: https://datasheet.ciiva.com/8886/pyu-rc0201-51-rohs-l-8-8886758.pdf?src-supplier=Avnet; ComponentLink3URL: https://datasheet.ciiva.com/16855/pyu-rc0201-51-rohs-l-8-16855847.pdf?src-supplier=Avnet+Europe; ComponentLink3Description: https://datasheet.ciiva.com/16855/pyu-rc0201-51-rohs-l-8-16855847.pdf?src-supplier=Avnet+Europe; ComponentLink4URL: https://datasheet.ciiva.com/28393/pyu-rc0201-51-rohs-l-8-28393063.pdf?src-supplier=Avnet+Europe; ComponentLink4Description: https://datasheet.ciiva.com/28393/pyu-rc0201-51-rohs-l-8-28393063.pdf?src-supplier=Avnet+Europe; Supplier Part Number 1: YAG2509CT-ND; LCSC Part Number: C274342
R34-R37 = RC0201FR-0722RL: RES 22 OHM 1% 1/20W 0201; Manufacturer: Yageo; Item Type: Resistor; Supplier: Future Electronics; Supplier Part Number: 5973409; Manufacturer Part Number: RC0201FR-0722RL; RoHS: Yes; Category: Chip SMD Resistors; Stock: 17980000; Pricing: 10000=0.0014, 50000=0.0013, 250000=0.0013, 750000=0.0012, 2000000=0.0011 (USD); ComponentLink1URL: https://datasheet.ciiva.com/7672/1563626-7672215.pdf?src-supplier=Element14; ComponentLink1Description: https://datasheet.ciiva.com/7672/1563626-7672215.pdf?src-supplier=Element14; LCSC Part Number: C155743
R40 = RC0402FR-07680KL: RES 680K OHM 1% 1/16W 0402; Manufacturer: Yageo; Voltage Rating (AC): 50V; Item Type: Resistor; Supplier: Future Electronics; Supplier Part Number: 1282912; Manufacturer Part Number: RC0402FR-07680KL; RoHS: Yes; Category: Chip SMD Resistors; Stock: 430000; Pricing: 10000=0.0018, 50000=0.0017, 300000=0.0016, 1000000=0.0015, 3000000=0.0014 (USD); ComponentLink1URL: https://datasheet.ciiva.com/15189/getdatasheetpartid-326365-15189498.pdf?src-supplier=Verical; ComponentLink1Description: https://datasheet.ciiva.com/15189/getdatasheetpartid-326365-15189498.pdf?src-supplier=Verical; ComponentLink2URL: https://datasheet.ciiva.com/17423/pyu-rc0402-51-rohs-l-6-r-17423807.pdf?src-supplier=Future+Electronics; ComponentLink2Description: https://datasheet.ciiva.com/17423/pyu-rc0402-51-rohs-l-6-r-17423807.pdf?src-supplier=Future+Electronics; ComponentLink3URL: https://datasheet.ciiva.com/7850/1018594-7850069.pdf?src-supplier=Element14; ComponentLink3Description: https://datasheet.ciiva.com/7850/1018594-7850069.pdf?src-supplier=Element14; LCSC Part Number: C163456
R41 = RC0402FR-07470KL: RES 470K OHM 1% 1/16W 0402; Manufacturer: Yageo; Value: 470kR; Power Rating: 62.5mW; Voltage Rating: 50V; Temperature Coefficient: 100ppm/°C; Max Power Dissipation: 63mW; Item Type: Resistor; Supplier: Future Electronics; Supplier Part Number: 7702467; Manufacturer Part Number: RC0402FR-07470KL; RoHS: Yes; Category: Chip SMD Resistors; Stock: 330000; Pricing: 10000=0.0009, 50000=0.0008, 300000=0.0008, 1000000=0.0007, 3000000=0.0007 (USD); Case/Package: 0402; Pins: 2; Case Code (Imperial): 0402; Case Code (Metric): 1005; Min Operating Temperature: -55°C; Max Operating Temperature: 155°C; Tolerance: 1%; Packaging: Tape and Reel; Voltage Rating (DC): 50V; Package Quantity: 1; Termination: SMD/SMT; Resistor Type: Thick Film; Number of Terminations: 2; Features: Moisture Resistant; Series: RC; Resistance Tolerance: 1%; Construction: Rectangular; Technology: THICK FILM; Voltage Rating (AC): 50V; Length: 0.039inch; Width: 0.02inch; Height: 0.016inch; Depth: 0.5mm; RoHS Compliant: Yes; Reach SVHC Compliant: No; Military Standard: Not; Lead Free: 5697LeadFree; ComponentLink1URL: https://datasheet.ciiva.com/11819/0900766b80c66297-11819514.pdf?src-supplier=Rs; ComponentLink1Description: https://datasheet.ciiva.com/11819/0900766b80c66297-11819514.pdf?src-supplier=Rs; ComponentLink2URL: https://datasheet.ciiva.com/46412/1018594-46412837.pdf?src-supplier=Element14; ComponentLink2Description: https://datasheet.ciiva.com/46412/1018594-46412837.pdf?src-supplier=Element14; ComponentLink3URL: https://datasheet.ciiva.com/2453/pyu-r-int-thick-7-2453434.pdf?src-supplier=Digi-Key; ComponentLink3Description: https://datasheet.ciiva.com/2453/pyu-r-int-thick-7-2453434.pdf?src-supplier=Digi-Key; ComponentLink4URL: https://datasheet.ciiva.com/2453/pyu-r-int-thick-7-2453435.pdf?src-supplier=Digi-Key; ComponentLink4Description: https://datasheet.ciiva.com/2453/pyu-r-int-thick-7-2453435.pdf?src-supplier=Digi-Key; ComponentLink5URL: https://datasheet.ciiva.com/2453/pyu-r-int-thick-7-2453433.pdf?src-supplier=Digi-Key; ComponentLink5Description: https://datasheet.ciiva.com/2453/pyu-r-int-thick-7-2453433.pdf?src-supplier=Digi-Key; ComponentLink6URL: https://datasheet.ciiva.com/7850/1018594-7850012.pdf?src-supplier=Element14; ComponentLink6Description: https://datasheet.ciiva.com/7850/1018594-7850012.pdf?src-supplier=Element14; ComponentLink7URL: https://datasheet.ciiva.com/7850/1018594-7850013.pdf?src-supplier=Element14; ComponentLink7Description: https://datasheet.ciiva.com/7850/1018594-7850013.pdf?src-supplier=Element14; ComponentLink8URL: https://datasheet.ciiva.com/15189/getdatasheetpartid-325138-15189462.pdf?src-supplier=Verical; ComponentLink8Description: https://datasheet.ciiva.com/15189/getdatasheetpartid-325138-15189462.pdf?src-supplier=Verical; LCSC Part Number: C137976
U7 = A7672E (FASE): RF TXRX MODULE CELLULAR SMD; Manufacturer: SIMCom Wireless Solutions Limited; Item Type: IC Module; Manufacturer Part Number: A7672E (FASE); Package: 80-SMD Module; ComponentLink1Description: Digikey; ComponentLink1URL: https://www.digikey.com/en/products/detail/simcom-wireless-solutions-limited/A7672E-FASE/15841437
U8 U9 = TXB0102DCUT: IC TRNSLTR BIDIRECTIONAL US8; Manufacturer: Texas Instruments; Propagation Delay: 31ns; Min Supply Voltage: 1.65V; Max Supply Voltage: 5.5V; Data Rate: 100Mbps; Number of Channels: 2; Logic Function: Translator; Turn-On Delay Time: 7.4ns; High Level Output Current: -20uA; Low Level Output Current: 20uA; Output Type: 3-STATE; Output Current: 50mA; Supplier 1: Arrow Electronics; Manufacturer Part Number: TXB0102DCUT; RoHS: Yes; Category: Integrated Circuits (ICs); Stock 1: 10; Pricing 1: 1=0.79330, 10=0.66470, 25=0.65820, 250=0.37450, 500=0.36200, 1000=0.29770, 2500=0.28440 (USD); Mount: Surface Mount; Case/Package: VSSOP; Number of Pins: 8; Weight: 0.000339oz; Contact Plating: Gold; Min Operating Temperature: -40°C; Max Operating Temperature: 85°C; Packaging: Tape and Reel; Package Quantity: 1; Number of Bits: 2; Series: -; Number of Inputs: 2; Length: 2.3mm; Width: 2mm; Height: 0.85mm; Radiation Hardening: No; Lead Free: Lead Free; RoHS Compliant: Yes; REACH SVHC: No SVHC; ComponentLink1URL: https://datasheet.ciiva.com/4226/sces641b-4226901.pdf?src-supplier=Arrow+Electronics; ComponentLink1Description: https://datasheet.ciiva.com/4226/sces641b-4226901.pdf?src-supplier=Arrow+Electronics; ComponentLink2URL: https://datasheet.ciiva.com/15096/getdatasheetpartid-226009-15096242.pdf?src-supplier=Verical; ComponentLink2Description: https://datasheet.ciiva.com/15096/getdatasheetpartid-226009-15096242.pdf?src-supplier=Verical; ComponentLink3URL: https://datasheet.ciiva.com/14287/txb0102-14287498.pdf?src-supplier=Avnet; ComponentLink3Description: https://datasheet.ciiva.com/14287/txb0102-14287498.pdf?src-supplier=Avnet; ComponentLink4URL: https://datasheet.ciiva.com/14287/txb0102-14287370.pdf?src-supplier=Avnet; ComponentLink4Description: https://datasheet.ciiva.com/14287/txb0102-14287370.pdf?src-supplier=Avnet; ComponentLink5URL: https://datasheet.ciiva.com/6619/txb0102-6619255.pdf?src-supplier=Digi-Key; ComponentLink5Description: https://datasheet.ciiva.com/6619/txb0102-6619255.pdf?src-supplier=Digi-Key; ComponentLink6URL: https://datasheet.ciiva.com/6619/txb0102-6619256.pdf?src-supplier=Digi-Key; ComponentLink6Description: https://datasheet.ciiva.com/6619/txb0102-6619256.pdf?src-supplier=Digi-Key; ComponentLink7URL: https://datasheet.ciiva.com/6619/txb0102-6619257.pdf?src-supplier=Digi-Key; ComponentLink7Description: https://datasheet.ciiva.com/6619/txb0102-6619257.pdf?src-supplier=Digi-Key; Supplier Part Number 1: TXB0102DCUT
U10 = SMF05CT1G-ES: 15V 5 Unidirectional 5V SOT-363 ESD Protection Devices ROHS; Manufacturer: ElecSuper; Item Type: ESD Diode; Manufacturer Part Number: SMF05CT1G-ES; Package: SOT-363; LCSC Part Number: C5180312; ComponentLink1Description: LCSC; ComponentLink1URL: https://www.lcsc.com/product-detail/ESD-Protection-Devices_ElecSuper-SMF05CT1G-ES_C5180312.html